# Altium project EFI_Main_Board-V1.00.PrjPcb (part 2 of 2)

## Sheet Peripheral_Sheet.SchDoc
size 420 x 297 mm; SheetNumber: 4; SheetTotal: 5
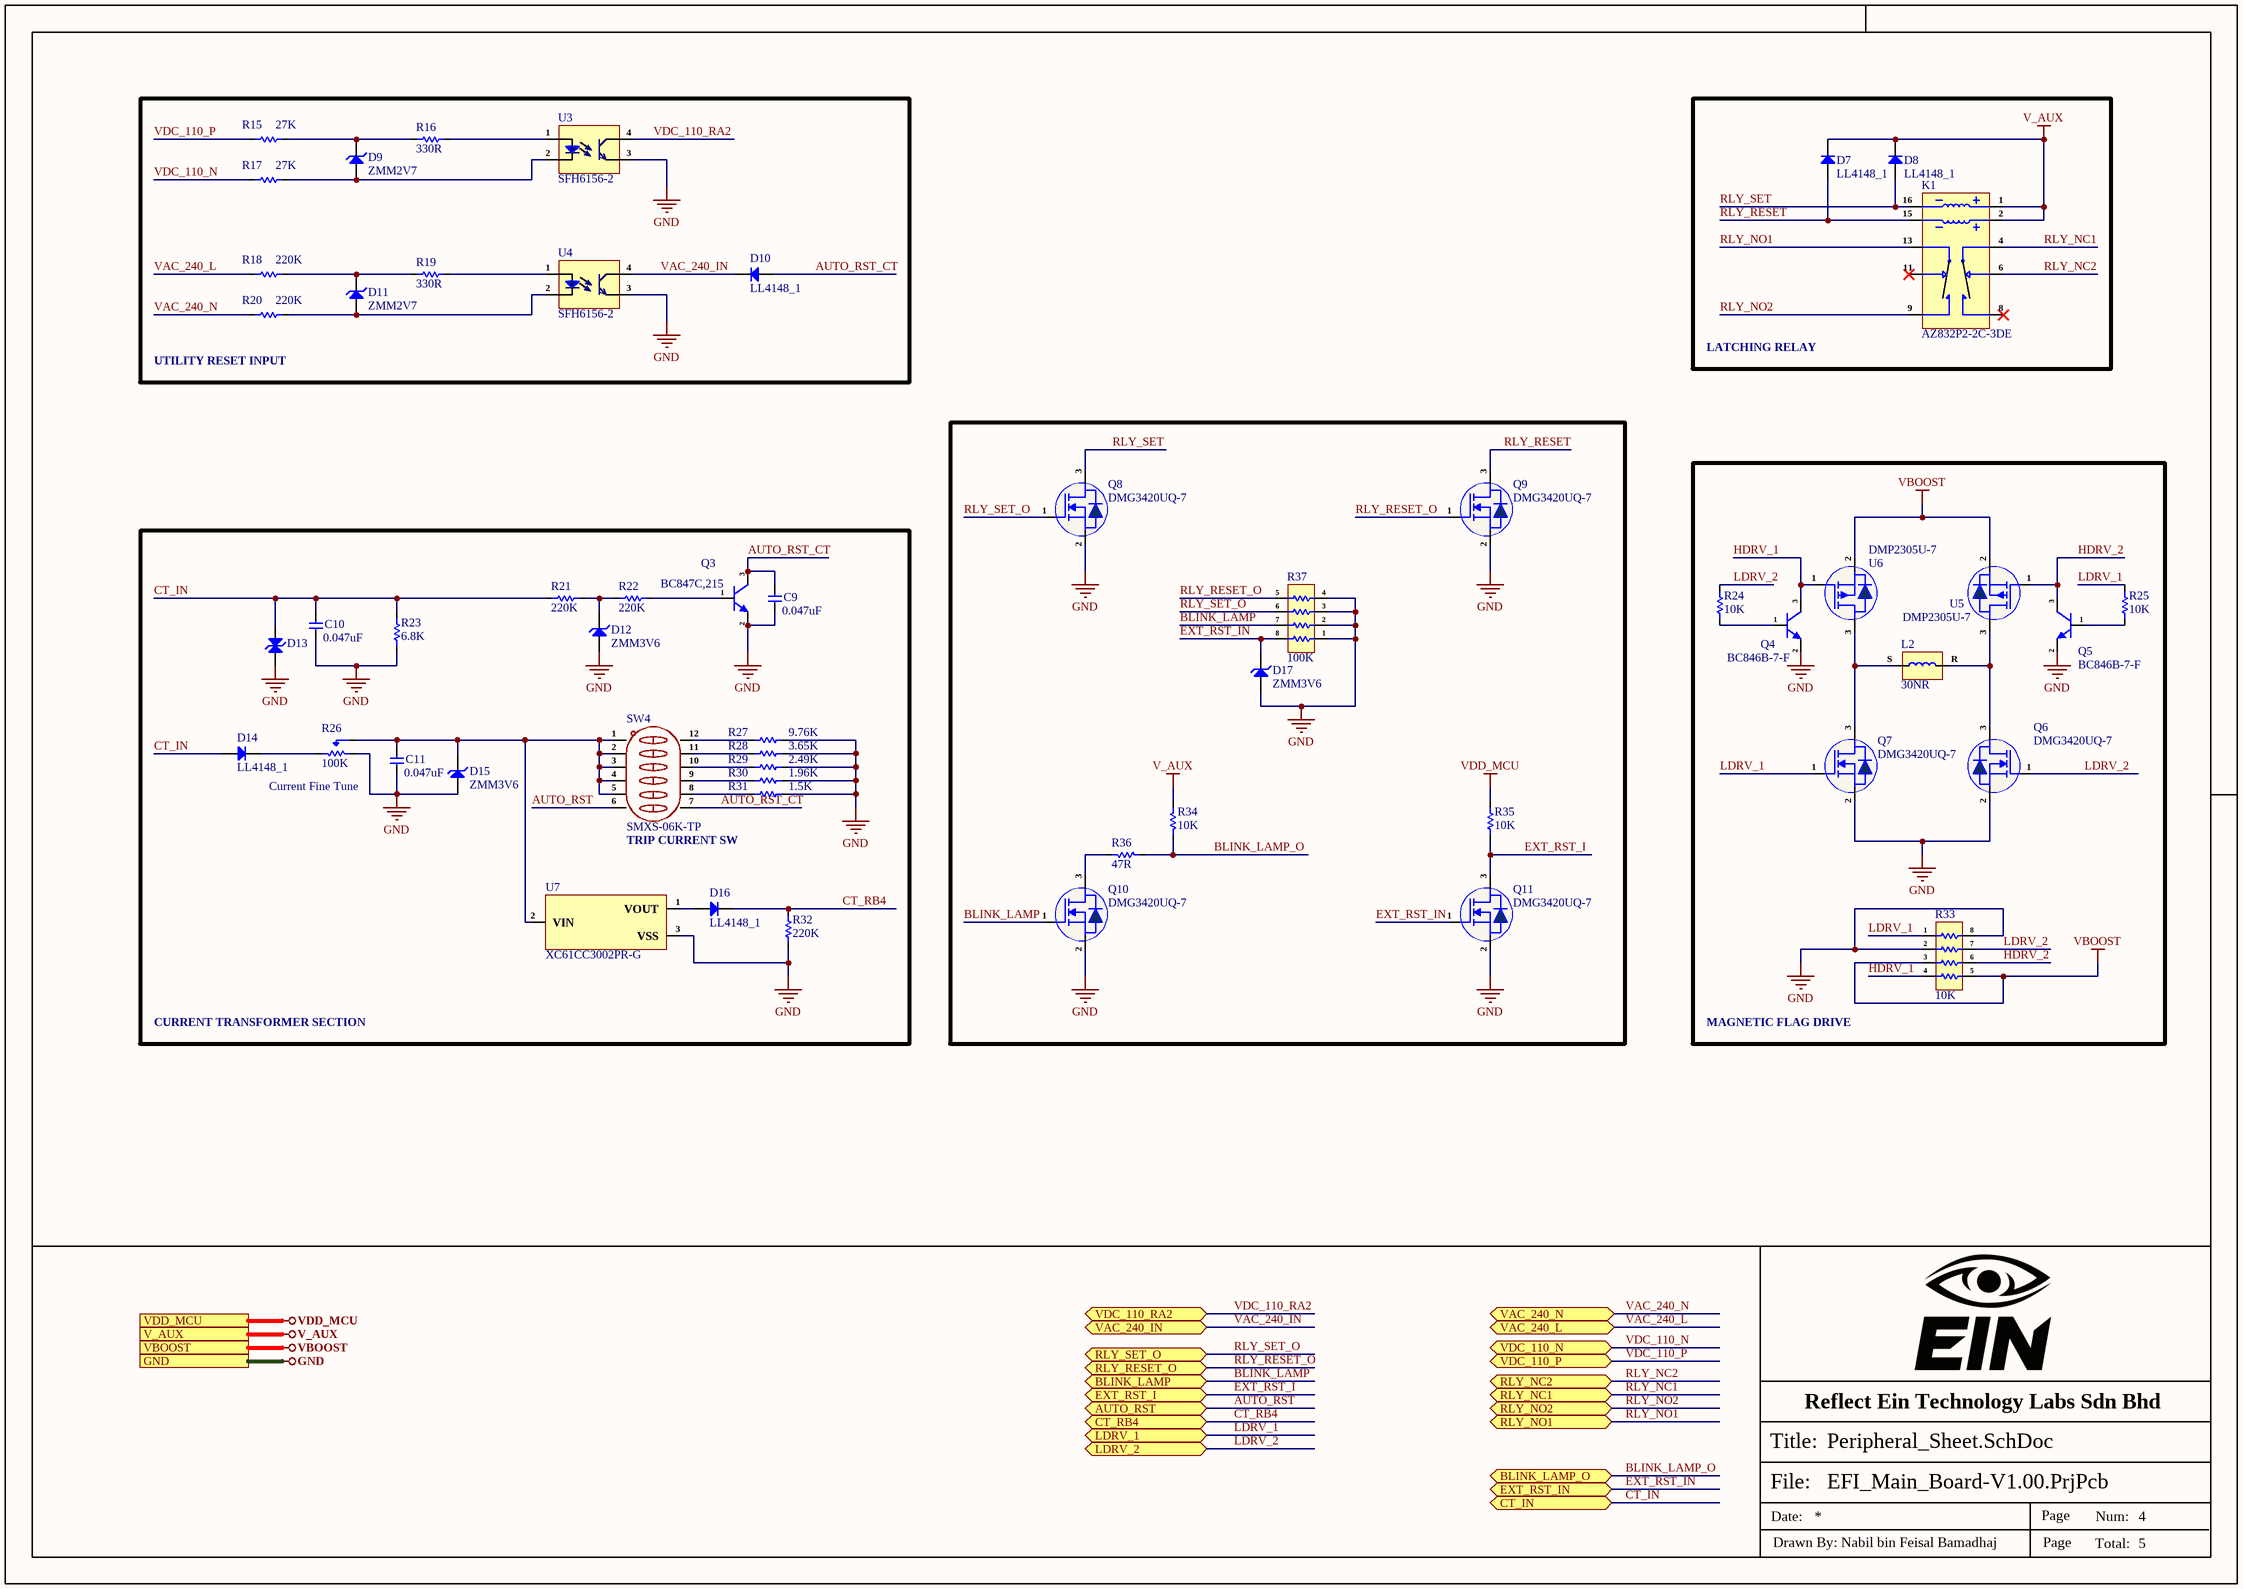
[diagram p4: Peripheral_Sheet.SchDoc]

### Parts
C9  0.047uF  [Cap-1206]
C10  0.047uF  [Cap-1206]
C11  0.047uF  [Cap-1206]
D7  LL4148_1  [LL-34]
D8  LL4148_1  [LL-34]
D9  ZMM2V7  [LL-34]
D10  LL4148_1  [LL-34]
D11  ZMM2V7  [LL-34]
D12  ZMM3V6  [LL-34]
D13  SMAJ48CA-E3/61  [SMA Bi Directional]  (value not drawn)
D14  LL4148_1  [LL-34]
D15  ZMM3V6  [LL-34]
D16  LL4148_1  [LL-34]
D17  ZMM3V6  [LL-34]
K1  AZ832P2-2C-3DE  [AZ832P2-2C-3DE]
L2  30NR  [30NR]
Q3  BC847C,215  [SOT-23]
Q4  BC846B-7-F  [SOT-23]
Q5  BC846B-7-F  [SOT-23]
Q6  DMG3420UQ-7  [SOT-23]
Q7  DMG3420UQ-7  [SOT-23]
Q8  DMG3420UQ-7  [SOT-23]
Q9  DMG3420UQ-7  [SOT-23]
Q10  DMG3420UQ-7  [SOT-23]
Q11  DMG3420UQ-7  [SOT-23]
R15  27K  [Res-1206]
R16  330R  [Res-1206]
R17  27K  [Res-1206]
R18  220K  [Res-1206]
R19  330R  [Res-1206]
R20  220K  [Res-1206]
R21  220K  [Res-1206]
R22  220K  [Res-1206]
R23  6.8K  [Res-1206]
R24  10K  [Res-1206]
R25  10K  [Res-1206]
R26  100K  [T93YA104KT20]
R27  9.76K  [Res-1206]
R28  3.65K  [Res-1206]
R29  2.49K  [Res-1206]
R30  1.96K  [Res-1206]
R31  1.5K  [Res-1206]
R32  220K  [Res-1206]
R33  10K  [0603x4]
R34  10K  [Res-1206]
R35  10K  [Res-1206]
R36  47R  [Res-1206]
R37  100K  [YC164-JR-070RL]
SW4  SMXS-06K-TP  [SMXS-06K-TP]
U3  SFH6156-2  [SFH6156-2]
U4  SFH6156-2  [SFH6156-2]
U5  DMP2305U-7  [SOT-23]
U6  DMP2305U-7  [SOT-23]
U7  XC61CC3002PR-G  [SOT-89-3]

### Blocks framed on the sheet
UTILITY RESET INPUT: D9-D11 R15-R20 U3 U4
LATCHING RELAY: D7 D8 K1
MAGNETIC FLAG DRIVE: L2 Q4-Q7 R24 R25 R33 U5 U6

### Ports
AUTO_RST (bidir, see Top-Sheet[4B], Controller_Sheet[4D]), BLINK_LAMP (bidir, see Top-Sheet[4B], Controller_Sheet[4D]), BLINK_LAMP_O (bidir, see Top-Sheet[4B], Connector_Sheet[4D]), CT_IN (bidir, see Top-Sheet[4B], Connector_Sheet[4D]), CT_RB4 (bidir, see Top-Sheet[4B], Controller_Sheet[4D]), EXT_RST_I (bidir, see Top-Sheet[4B], Controller_Sheet[4D]), EXT_RST_IN (bidir, see Top-Sheet[4B], Connector_Sheet[4D]), GND (see Top-Sheet[4B], Connector_Sheet[1D], Controller_Sheet[1D], Power_Sheet[1D]), LDRV_1 (bidir, see Top-Sheet[4B], Controller_Sheet[4D]), LDRV_2 (bidir, see Top-Sheet[4B], Controller_Sheet[4D]), RLY_NC1 (bidir, see Top-Sheet[4B], Connector_Sheet[4D]), RLY_NC2 (bidir, see Top-Sheet[4B], Connector_Sheet[4D]), RLY_NO1 (bidir, see Top-Sheet[4B], Connector_Sheet[4D]), RLY_NO2 (bidir, see Top-Sheet[4B], Connector_Sheet[4D]), RLY_RESET_O (bidir, see Top-Sheet[4B], Controller_Sheet[4D]), RLY_SET_O (bidir, see Top-Sheet[4B], Controller_Sheet[4D]), V_AUX (see Top-Sheet[4A], Connector_Sheet[1D], Power_Sheet[1D]), VAC_240_IN (bidir, see Top-Sheet[4B], Controller_Sheet[4D]), VAC_240_L (bidir, see Top-Sheet[4B], Connector_Sheet[4D]), VAC_240_N (bidir, see Top-Sheet[4B], Connector_Sheet[4D]), VBOOST (see Top-Sheet[4B], Power_Sheet[1D]), VDC_110_N (bidir, see Top-Sheet[4B], Connector_Sheet[4D]), VDC_110_P (bidir, see Top-Sheet[4B], Connector_Sheet[4D]), VDC_110_RA2 (bidir, see Top-Sheet[4B], Controller_Sheet[4D]), VDD_MCU (see Top-Sheet[4A], Controller_Sheet[1D], Power_Sheet[1D])

### Nets
GND: C9.1 C10.1 C11.1 D12.2(A) D13.1(A) D15.2(A) D17.2(A) Q3.2(E) Q4.2(E) Q5.2(E) Q6.2(S) Q7.2(S) Q8.2(S) Q9.2(S) Q10.2(S) Q11.2(S) R23.1 R26.1(CCW) R27.2 R28.2 R29.2 R30.2 R31.2 R32.2 R33.2 R33.8 R37.1 R37.2 R37.3 R37.4 U3.3(E) U4.3(E) U7.3(VSS) ; port GND
V_AUX: D7.1(K) D8.1(K) K1.1 K1.2 R34.2 ; port V_AUX
VBOOST: R33.3 R33.5 U5.2(S) U6.2(S) ; port VBOOST
VDD_MCU: R35.2 ; port VDD_MCU
AUTO_RST: SW4.6 ; port AUTO_RST
AUTO_RST_CT: C9.2 D10.2(A) Q3.3(C) SW4.7
BLINK_LAMP: Q10.1(G) R37.7 ; port BLINK_LAMP
BLINK_LAMP_O: R34.1 R36.1 ; port BLINK_LAMP_O
CT_IN: C10.2 D13.2(A) D14.2(A) R21.2 R23.2 ; port CT_IN
CT_RB4: D16.1(K) R32.1 ; port CT_RB4
EXT_RST_I: Q11.3(D) R35.1 ; port EXT_RST_I
EXT_RST_IN: D17.1(K) Q11.1(G) R37.8 ; port EXT_RST_IN
HDRV_1: Q4.3(C) R33.4 U6.1(G)
HDRV_2: Q5.3(C) R33.6 U5.1(G)
LDRV_1: Q7.1(G) R25.2 R33.1 ; port LDRV_1
LDRV_2: Q6.1(G) R24.2 R33.7 ; port LDRV_2
RLY_NC1: K1.4 ; port RLY_NC1
RLY_NC2: K1.6 ; port RLY_NC2
RLY_NO1: K1.13 ; port RLY_NO1
RLY_NO2: K1.9 ; port RLY_NO2
RLY_RESET: D7.2(A) K1.15 Q9.3(D)
RLY_RESET_O: Q9.1(G) R37.5 ; port RLY_RESET_O
RLY_SET: D8.2(A) K1.16 Q8.3(D)
RLY_SET_O: Q8.1(G) R37.6 ; port RLY_SET_O
VAC_240_IN: D10.1(K) U4.4(C) ; port VAC_240_IN
VAC_240_L: R18.2 ; port VAC_240_L
VAC_240_N: R20.2 ; port VAC_240_N
VDC_110_N: R17.1 ; port VDC_110_N
VDC_110_P: R15.1 ; port VDC_110_P
VDC_110_RA2: U3.4(C) ; port VDC_110_RA2
NetC11_2: C11.2 D15.1(K) R26.2(Wiper) SW4.1 SW4.2 SW4.3 SW4.4 SW4.5 U7.2(VIN)
NetD9_1: D9.1(K) R15.2 R16.1
NetD9_2: D9.2(A) R17.2 U3.2(Ca)
NetD11_1: D11.1(K) R18.1 R19.1
NetD11_2: D11.2(A) R20.1 U4.2(Ca)
NetD12_1: D12.1(K) R21.1 R22.2
NetD14_1: D14.1(K) R26.3(CW)
NetD16_2: D16.2(A) U7.1(VOUT)
NetL2_R: L2.R Q6.3(D) U5.3(D)
NetL2_S: L2.S Q7.3(D) U6.3(D)
NetQ3_1: Q3.1(B) R22.1
NetQ4_1: Q4.1(B) R24.1
NetQ5_1: Q5.1(B) R25.1
NetQ10_3: Q10.3(D) R36.2
NetR16_2: R16.2 U3.1(An)
NetR19_2: R19.2 U4.1(An)
NetR27_1: R27.1 SW4.12
NetR28_1: R28.1 SW4.11
NetR29_1: R29.1 SW4.10
NetR30_1: R30.1 SW4.9
NetR31_1: R31.1 SW4.8

Not connected (* = marked no-connect by the designer): K1 8* 11*

### Notes on the sheet
- Current Fine Tune
- (near SW4) TRIP CURRENT SW
- CURRENT TRANSFORMER SECTION
- Reflect Ein Technology Labs Sdn Bhd
- File:
- Title:
- Date:
- Page
- Num:
- Total:
- Drawn By: Nabil bin Feisal Bamadhaj

### Library data of the parts
C9-C11 = CC1206JRX7R0BB473: CAP CER 0.047UF 100V X7R 1206; Manufacturer: Yageo; Tolerance: 5%; Capacitance: 47nF; Item Type: Capacitor; Supplier 1: Arrow Electronics; Manufacturer Part Number: CC1206JRX7R0BB473; RoHS: Yes; Category: Ceramic Capacitors; Stock 1: 6600; Pricing 1: 1=0.21620, 10=0.10530, 25=0.10420, 100=0.08480, 250=0.08390, 500=0.05860, 1000=0.05090, 3000=0.04900, 6000=0.02930 (USD); Mount: Surface Mount; Case/Package: 1206; Case Code (Imperial): 1206; Case Code (Metric): 3216; Min Operating Temperature: -55°C; Max Operating Temperature: 125°C; Packaging: Tape and Reel; Voltage Rating (DC): 100V; Dielectric: X7R; Termination: SMD/SMT; Resistor Type: Ceramic; Voltage Rating: 100V; Series: CC; Construction: Flat; Length: 3.2mm; Width: 1.6mm; Height: 0.85mm; Thickness: 0.037inch; Depth: 1.6mm; Radiation Hardening: No; RoHS Compliant: Yes; ComponentLink1URL: https://datasheet.ciiva.com/11465/upy-np0x7r-mv-100-to-630v-9-11465413.pdf?src-supplier=Avnet; ComponentLink1Description: https://datasheet.ciiva.com/11465/upy-np0x7r-mv-100-to-630v-9-11465413.pdf?src-supplier=Avnet; ComponentLink2URL: https://datasheet.ciiva.com/13210/upy-gp-np0-16v-to-50v-8-13210277.pdf?src-supplier=Mouser; ComponentLink2Description: https://datasheet.ciiva.com/13210/upy-gp-np0-16v-to-50v-8-13210277.pdf?src-supplier=Mouser; Supplier Part Number 1: CC1206JRX7R0BB473; LCSC Part Number: C577197
D7 D8 D10 D14 D16 = LL4148_1: 100V 1V@50mA 4ns 300mA LL-34 Switching Diodes ROHS; Manufacturer: Yangzhou Yangjie Elec Tech; Manufacturer Part Number: LL4148; Item Type: Diode; Package: LL-34; LCSC Part Number: C211750; ComponentLink1Description: LCSC; ComponentLink1URL: https://www.lcsc.com/product-detail/Switching-Diodes_Yangzhou-Yangjie-Elec-Tech-LL4148_C211750.html
D9 D11 = ZMM2V7: Independent Type 2.5V~2.9V 500mW 2.7V LL-34 Zener Diodes ROHS; Manufacturer: HXY MOSFET; Item Type: Diode; Manufacturer Part Number: ZMM2V7; Package: LL-34; LCSC Part Number: C2891738; ComponentLink1Description: LCSC; ComponentLink1URL: https://www.lcsc.com/product-detail/Zener-Diodes_YONGYUTAI-ZMM2V7_C2891738.html
D12 D15 D17 = ZMM3V6: Independent Type 500mW 3.4V~3.8V 3.6V LL-34 Zener Diodes ROHS; Manufacturer: HXY MOSFET; Item Type: Diode; Manufacturer Part Number: ZMM3V6; Package: LL-34; LCSC Part Number: C5345988; ComponentLink1Description: LCSC; ComponentLink1URL: https://www.lcsc.com/product-detail/Zener-Diodes_HXY-MOSFET-ZMM3V6_C5345988.html
D13 = SMAJ48CA-E3/61: TVS DIODE 48VWM 77.4VC DO214AC; Manufacturer: Vishay Semiconductors; Item Type: TVS Diodes; Supplier: Mouser; LCSC Part Number: C1973118; Manufacturer Part Number: SMAJ48CA-E3/61; RoHS: Yes; Stock: 8896; Pricing: 1=0.35, 10=0.202, 50=0.202, 100=0.099, 1000=0.099, 10000=0.072 (USD); ComponentLink1URL: https://datasheet.ciiva.com/23942/1761247-23942001.pdf?src-supplier=Newark; ComponentLink1Description: https://datasheet.ciiva.com/23942/1761247-23942001.pdf?src-supplier=Newark; ComponentLink2URL: https://datasheet.ciiva.com/22636/548547-22636982.pdf?src-supplier=Element14; ComponentLink2Description: https://datasheet.ciiva.com/22636/548547-22636982.pdf?src-supplier=Element14
K1 = AZ832P2-2C-3DE: Magnetic Latching Relays ROHS; Manufacturer: ZETTLER; Item Type: Relay; Manufacturer Part Number: AZ832P2-2C-3DE; Package: Custom; LCSC Part Number: C20262850; ComponentLink1Description: LCSC; ComponentLink1URL: https://www.lcsc.com/product-detail/Magnetic-Latching-Relays_ZETTLER-AZ832P2-2C-3DE_C20262850.html?s_z=n_AZ832P2-2C-3DE
L2 = 30NR: Magnetic Status Indicator
Q3 = BC847C,215: TRANS NPN 45V 0.1A TO-236AB; Manufacturer: Nexperia; Item Type: BJTs; Polarity: 5054Direction; Supplier: Future Electronics; LCSC Part Number: C8664; Manufacturer Part Number: BC847C,215; RoHS: Yes; Stock: 18000; Pricing: 3000=0.0084, 12000=0.0081, 30000=0.0079, 75000=0.0077, 120000=0.0074 (USD); Pins: 3NUMBER; Packaging: 13Packaging; RoHS Compliant: Yes; ComponentLink1URL: http://www.farnell.com/datasheets/1856333.pdf?src-supplier=Farnell; ComponentLink1Description: http://www.farnell.com/datasheets/1856333.pdf?src-supplier=Farnell; ComponentLink2URL: https://assets.nexperia.com/documents/data-sheet/BC847_SER.pdf?src-supplier=Digikey; ComponentLink2Description: https://assets.nexperia.com/documents/data-sheet/BC847_SER.pdf?src-supplier=Digikey; ComponentLink3URL: https://datasheet.octopart.com/BC847C%2C215-NXP-Semiconductors-datasheet-20734447.pdf?src-supplier=Farnell; ComponentLink3Description: https://datasheet.octopart.com/BC847C%2C215-NXP-Semiconductors-datasheet-20734447.pdf?src-supplier=Farnell; ComponentLink4URL: https://datasheet.octopart.com/BC847C%2C215-Nexperia-datasheet-164345412.pdf?src-supplier=Future+Electronics; ComponentLink4Description: https://datasheet.octopart.com/BC847C%2C215-Nexperia-datasheet-164345412.pdf?src-supplier=Future+Electronics; ComponentLink5URL: https://datasheet.octopart.com/BC847C%2C215-Nexperia-datasheet-11982477.pdf?src-supplier=Newark; ComponentLink5Description: https://datasheet.octopart.com/BC847C%2C215-Nexperia-datasheet-11982477.pdf?src-supplier=Newark; ComponentLink6URL: https://datasheet.octopart.com/BC847C%2C215-Nexperia-datasheet-5341283.pdf?src-supplier=TME; ComponentLink6Description: https://datasheet.octopart.com/BC847C%2C215-Nexperia-datasheet-5341283.pdf?src-supplier=TME
Q4 Q5 = BC846B-7-F: TRANS NPN 65V 0.1A SOT23-3; Manufacturer: Diodes; Item Type: Transistors; Supplier: Future Electronics; Supplier Part Number: 3888237; Manufacturer Part Number: BC846B-7-F; RoHS: Yes; Category: BJTs; Stock: 4416000; Pricing: 3000=0.0363, 12000=0.0348, 45000=0.0335, 120000=0.0325, 300000=0.0309 (USD); ComponentLink1URL: https://datasheet.ciiva.com/15139/getdatasheetpartid-139519-15139459.pdf?src-supplier=Verical; ComponentLink1Description: https://datasheet.ciiva.com/15139/getdatasheetpartid-139519-15139459.pdf?src-supplier=Verical; ComponentLink2URL: https://datasheet.ciiva.com/22711/1911717-22711685.pdf?src-supplier=Element14; ComponentLink2Description: https://datasheet.ciiva.com/22711/1911717-22711685.pdf?src-supplier=Element14; LCSC Part Number: C183643
Q6-Q11 = DMG3420UQ-7: MOSFET BVDSS: 8V~24V SOT23 T&R 3; Manufacturer: Diodes; Item Type: MOSFETs; Supplier: Digikey; LCSC Part Number: C5157847; Manufacturer Part Number: DMG3420UQ-7; RoHS: Yes; Stock: 5879; Pricing: 1=0.45, 10=0.276, 100=0.1748, 500=0.1308, 1000=0.11658 (USD); RoHS Compliant: Yes
R15 R17 = FRC1206F2702TS: 250mW Thick Film Resistors 200V ±100ppm/℃ ±1% 27kΩ 1206 Chip Resistor - Surface Mount ROHS; Manufacturer: FOJAN; Manufacturer Part Number: FRC1206F2702TS; Package: 1206; LCSC Part Number: C2960927; Item Type: Resistor; ComponentLink1Description: LCSC; ComponentLink1URL: https://www.lcsc.com/product-detail/Chip-Resistor-Surface-Mount_FOJAN-FRC1206F2702TS_C2960927.html
R16 R19 = FRC1206F3300TS: 250mW Thick Film Resistors 200V ±100ppm/℃ ±1% 330Ω 1206 Chip Resistor - Surface Mount ROHS; Manufacturer: FOJAN; Manufacturer Part Number: FRC1206F3300TS; Package: 1206; LCSC Part Number: C2933675; Item Type: Resistor; ComponentLink1Description: LCSC; ComponentLink1URL: https://www.lcsc.com/product-detail/Chip-Resistor-Surface-Mount_FOJAN-FRC1206F3300TS_C2933675.html
R18 R20-R22 R32 = RT1206BRD07220KL: RES SMD 220K OHM 0.1% 1/4W 1206; Manufacturer: Yageo; Item Type: Resistors; Voltage Rating (DC): 200V; Supplier: Digikey; LCSC Part Number: C309663; Manufacturer Part Number: RT1206BRD07220KL; RoHS: Yes; Stock: 10004; Pricing: 1=0.34, 10=0.225, 50=0.1816, 100=0.1663, 500=0.1326, 1000=0.11628 (USD); Lead Free: 5697LeadFree; ComponentLink1URL: https://datasheet.ciiva.com/2587/pyu-rt-1-to-0-05-rohs-l-5-2587527.pdf?src-supplier=Digikey; ComponentLink1Description: https://datasheet.ciiva.com/2587/pyu-rt-1-to-0-05-rohs-l-5-2587527.pdf?src-supplier=Digikey
R23 = AR06BTCV6801A010: 250mW Thin Film Resistor 150V ±25ppm/℃ ±0.1% 6.8kΩ 1206 Chip Resistor - Surface Mount ROHS; Manufacturer: Viking Tech; Manufacturer Part Number: AR06BTCV6801A010; Package: 1206; LCSC Part Number: C374801; Item Type: Resistor; ComponentLink1Description: LCSC; ComponentLink1URL: https://www.lcsc.com/product-detail/Chip-Resistor-Surface-Mount_Viking-Tech-AR06BTCV6801A010_C374801.html
R24 R25 R34 R35 = AC1206FR-7W10KL: RES 10K OHM 1% 1/2W 1206; Manufacturer: Yageo; Item Type: Resistors; Value: 10kR; Supplier: Mouser; LCSC Part Number: C326700; Manufacturer Part Number: AC1206FR-7W10KL; RoHS: No; Stock: 10222; Pricing: 1=0.14, 10=0.052, 50=0.052, 100=0.029, 1000=0.018, 10000=0.011 (USD); Case/Package: 340Case; Packaging: 10Packaging
R26 = T93YA104KT20: TRIMMER 100K OHM 0.5W PC PIN TOP; Manufacturer: Vishay Sfernice; Item Type: Potensiometer; Value: 100kR; Tolerance: 10%; Power Rating: 500mW; Voltage Rating: 250V; Number of Turns: 21; Temperature Coefficient: 100ppm/°C; Supplier: Future Electronics; LCSC Part Number: C7061693; Manufacturer Part Number: T93YA104KT20; RoHS: Yes; Stock: 500; Pricing: 500=0.835, 1000=0.82, 1500=0.815, 2000=0.81, 2500=0.795 (USD); Mounting Technology: PCB,Through Hole; Min Operating Temperature: -55°C; Max Operating Temperature: 155°C; Packaging: Rail/Tube; Series: T93; Technology: CERMET; Package Quantity: 50; Resistor Type: Cermet; Taper: Linear; Termination: Pin; Max Power Dissipation: 500mW; Resistance Tolerance: 10%; Voltage Rating (AC): 250V; Length: 0.382inch; Width: 0.197inch; Height: 0.386inch; Depth: 5mm; Radiation Hardening: No; Lead Free: Lead Free; RoHS Compliant: Yes; Reach SVHC Compliant: Unknown; ComponentLink1URL: https://datasheet.ciiva.com/11831/0900766b80ed9ad6-11831453.pdf?src-supplier=Rs; ComponentLink1Description: https://datasheet.ciiva.com/11831/0900766b80ed9ad6-11831453.pdf?src-supplier=Rs; ComponentLink2URL: https://datasheet.ciiva.com/2156/t93-2156473.pdf?src-supplier=Digikey; ComponentLink2Description: https://datasheet.ciiva.com/2156/t93-2156473.pdf?src-supplier=Digikey; ComponentLink3URL: https://datasheet.ciiva.com/16367/t93-16367128.pdf?src-supplier=Future+Electronics; ComponentLink3Description: https://datasheet.ciiva.com/16367/t93-16367128.pdf?src-supplier=Future+Electronics
R27 = RT1206BRD079K76L: RES SMD 9.76K OHM 0.1% 1/4W 1206; Manufacturer: Yageo; Item Type: Resistors; Supplier: Digikey; LCSC Part Number: C870957; Manufacturer Part Number: RT1206BRD079K76L; RoHS: Yes; Pricing: 5000=0.0862 (USD); ComponentLink1URL: https://datasheet.ciiva.com/2587/pyu-rt-1-to-0-05-rohs-l-5-2587915.pdf?src-supplier=Digikey; ComponentLink1Description: https://datasheet.ciiva.com/2587/pyu-rt-1-to-0-05-rohs-l-5-2587915.pdf?src-supplier=Digikey
R28 = RT1206BRD073K65L: RES SMD 3.65K OHM 0.1% 1/4W 1206; Manufacturer: Yageo; Item Type: Resistors; Value: 3.65kR; Power Rating: 250mW; Voltage Rating: 200V; Temperature Coefficient: 25ppm/°C; Supplier: Digikey; LCSC Part Number: C870714; Manufacturer Part Number: RT1206BRD073K65L; RoHS: Yes; Stock: 4762; Pricing: 1=0.35, 10=0.246, 50=0.1938, 100=0.1693, 500=0.12954, 1000=0.11424 (USD); Case/Package: 1206; Case Code (Metric): 3216; Case Code (Imperial): 1206; Weight: 0.000571oz; Min Operating Temperature: -55°C; Max Operating Temperature: 155°C; Tolerance: 0.1%; Package Quantity: 5000; Packaging: Tape and Reel; Number of Terminations: 2; Termination: SMD/SMT; Max Power Dissipation: 250mW; Voltage Rating (DC): 200V; Series: RT; Length: 0.122inch; Width: 1.6mm; Height: 0.026inch; Lead Free: Lead Free; RoHS Compliant: Yes; ComponentLink1URL: https://datasheet.ciiva.com/2587/pyu-rt-1-to-0-05-rohs-l-5-2587684.pdf?src-supplier=Digikey; ComponentLink1Description: https://datasheet.ciiva.com/2587/pyu-rt-1-to-0-05-rohs-l-5-2587684.pdf?src-supplier=Digikey; ComponentLink2URL: https://datasheet.ciiva.com/12812/pyu-rt-1-to-0-05-rohs-l-4-12812222.pdf?src-supplier=Mouser; ComponentLink2Description: https://datasheet.ciiva.com/12812/pyu-rt-1-to-0-05-rohs-l-4-12812222.pdf?src-supplier=Mouser
R29 = ARG06BTC2491: 250mW 200V ±25ppm/℃ ±0.1% 2.49kΩ 1206 Chip Resistor - Surface Mount ROHS; Manufacturer: Viking Tech; Manufacturer Part Number: ARG06BTC2491; Package: 1206; LCSC Part Number: C5122072; Item Type: Resistor; ComponentLink1Description: LCSC; ComponentLink1URL: https://www.lcsc.com/product-detail/Chip-Resistor-Surface-Mount_Viking-Tech-ARG06BTC2491_C5122072.html
R30 = RT1206BRD071K96L: RES SMD 1.96K OHM 0.1% 1/4W 1206; Manufacturer: Yageo; Item Type: Resistors; Value: 1.96kR; Temperature Coefficient: 25ppm/°C; Power Rating: 250mW; Voltage Rating: 200V; Supplier: Digikey; LCSC Part Number: C870518; Manufacturer Part Number: RT1206BRD071K96L; RoHS: Yes; Stock: 1289; Pricing: 1=0.34, 10=0.246, 50=0.1908, 100=0.1693, 500=0.1275, 1000=0.1122 (USD); Case/Package: 1206; Contact Plating: Tin,Matte; Case Code (Metric): 3216; Case Code (Imperial): 1206; Min Operating Temperature: -55°C; Max Operating Temperature: 125°C; Tolerance: 0.1%; Package Quantity: 5000; Packaging: Tape and Reel; Number of Terminations: 2; Termination: SMD/SMT; Max Power Dissipation: 250mW; Voltage Rating (DC): 200V; Series: RT; Length: 0.122inch; Width: 0.063inch; Height: 0.026inch; Lead Free: Lead Free; RoHS Compliant: Yes; ComponentLink1URL: https://datasheet.ciiva.com/2587/pyu-rt-1-to-0-05-rohs-l-5-2587508.pdf?src-supplier=Digikey; ComponentLink1Description: https://datasheet.ciiva.com/2587/pyu-rt-1-to-0-05-rohs-l-5-2587508.pdf?src-supplier=Digikey; ComponentLink2URL: https://datasheet.ciiva.com/8894/pyu-rt-1-to-0-05-rohs-l-4-8894855.pdf?src-supplier=Avnet; ComponentLink2Description: https://datasheet.ciiva.com/8894/pyu-rt-1-to-0-05-rohs-l-4-8894855.pdf?src-supplier=Avnet; ComponentLink3URL: https://datasheet.ciiva.com/12706/pyu-rt-1-to-0-05-rohs-l-4-12706684.pdf?src-supplier=Mouser; ComponentLink3Description: https://datasheet.ciiva.com/12706/pyu-rt-1-to-0-05-rohs-l-4-12706684.pdf?src-supplier=Mouser
R31 = RT1206BRD071K5L: RES SMD 1.5K OHM 0.1% 1/4W 1206; Manufacturer: Yageo; Item Type: Resistors; Value: 1.5kR; Power Rating: 250mW; Voltage Rating: 200V; Temperature Coefficient: 25ppm/°C; Supplier: Mouser; LCSC Part Number: C706403; Manufacturer Part Number: RT1206BRD071K5L; RoHS: Yes; Stock: 5782; Pricing: 1=0.36, 10=0.261, 50=0.202, 100=0.181, 1000=0.121, 10000=0.089 (USD); Case/Package: 1206; Case Code (Imperial): 1206; Case Code (Metric): 3216; Contact Plating: Tin,Matte; Min Operating Temperature: -55°C; Max Operating Temperature: 125°C; Tolerance: 0.1%; Packaging: Tape and Reel; Package Quantity: 5000; Number of Terminations: 2; Termination: SMD/SMT; Max Power Dissipation: 250mW; Voltage Rating (DC): 200V; Features: Moisture Resistant; Series: RT; Length: 0.122inch; Width: 0.063inch; Height: 0.026inch; Lead Free: Lead Free; RoHS Compliant: Yes; ComponentLink1URL: https://datasheet.ciiva.com/8895/pyu-rt-1-to-0-05-rohs-l-4-8895366.pdf?src-supplier=Avnet; ComponentLink1Description: https://datasheet.ciiva.com/8895/pyu-rt-1-to-0-05-rohs-l-4-8895366.pdf?src-supplier=Avnet; ComponentLink2URL: https://datasheet.ciiva.com/12703/pyu-rt-1-to-0-05-rohs-l-4-12703031.pdf?src-supplier=Mouser; ComponentLink2Description: https://datasheet.ciiva.com/12703/pyu-rt-1-to-0-05-rohs-l-4-12703031.pdf?src-supplier=Mouser; ComponentLink3URL: https://datasheet.ciiva.com/2587/pyu-rt-1-to-0-05-rohs-l-4-2587497.pdf?src-supplier=Digikey; ComponentLink3Description: https://datasheet.ciiva.com/2587/pyu-rt-1-to-0-05-rohs-l-4-2587497.pdf?src-supplier=Digikey; ComponentLink4URL: https://datasheet.ciiva.com/46635/pyu-rt-1-to-0-05-rohs-l-5-46635017.pdf?src-supplier=Digikey; ComponentLink4Description: https://datasheet.ciiva.com/46635/pyu-rt-1-to-0-05-rohs-l-5-46635017.pdf?src-supplier=Digikey
R33 = 4D03WGJ0103T5E: 4 ±5% 10kΩ 62.5mW ±200ppm/℃ 0603x4 Resistor Networks, Arrays ROHS; Manufacturer: Royal Electronic Factory; Value: 10kR; Temperature Coefficient: 400ppm/°C; Supplier: Mouser; LCSC Part Number: C29718; Manufacturer Part Number: 4D03WGJ0103T5E; RoHS: No; Item Type: Resistor; Pricing: 10000=0.005 (USD); ComponentLink1URL: https://datasheet.octopart.com/4D03WGJ0103T5E-Royal-Ohm-datasheet-158295248.pdf?src-supplier=TME; ComponentLink1Description: https://datasheet.octopart.com/4D03WGJ0103T5E-Royal-Ohm-datasheet-158295248.pdf?src-supplier=TME
R36 = FRC1206F47R0TS: 250mW Thick Film Resistors 200V ±100ppm/℃ ±1% 47Ω 1206 Chip Resistor - Surface Mount ROHS; Manufacturer: FOJAN; Manufacturer Part Number: FRC1206F47R0TS; Package: 1206; LCSC Part Number: C2933712; Item Type: Resistor; ComponentLink1Description: LCSC; ComponentLink1URL: https://www.lcsc.com/product-detail/Chip-Resistor-Surface-Mount_FOJAN-FRC1206F47R0TS_C2933712.html
R37 = YC164-JR-07100KL: RES ARRAY 4 RES 100K OHM 1206; Manufacturer: Yageo; Item Type: Resistor; Supplier: Future Electronics; Supplier Part Number: 4734737; Manufacturer Part Number: YC164-JR-07100KL; RoHS: Yes; Category: Resistor Arrays; Stock: 10000; Pricing: 5000=0.0086, 20000=0.0082, 50000=0.0078, 100000=0.0078, 125000=0.0075, 200000=0.0076, 625000=0.0071 (USD); ComponentLink1URL: https://datasheet.ciiva.com/11807/0900766b80c69e1d-11807026.pdf?src-supplier=Rs; ComponentLink1Description: https://datasheet.ciiva.com/11807/0900766b80c69e1d-11807026.pdf?src-supplier=Rs; ComponentLink2URL: https://datasheet.ciiva.com/8017/443424-8017993.pdf?src-supplier=Element14; ComponentLink2Description: https://datasheet.ciiva.com/8017/443424-8017993.pdf?src-supplier=Element14; ComponentLink3URL: https://datasheet.ciiva.com/8017/443424-8017994.pdf?src-supplier=Element14; ComponentLink3Description: https://datasheet.ciiva.com/8017/443424-8017994.pdf?src-supplier=Element14; ComponentLink4URL: https://datasheet.ciiva.com/17478/pyu-yc-tc164-51-rohs-l-3-17478885.pdf?src-supplier=Future+Electronics; ComponentLink4Description: https://datasheet.ciiva.com/17478/pyu-yc-tc164-51-rohs-l-3-17478885.pdf?src-supplier=Future+Electronics; ComponentLink5URL: https://datasheet.ciiva.com/2693/pyu-yc-tc164-51-rohs-l-3-2693249.pdf?src-supplier=Digi-Key; ComponentLink5Description: https://datasheet.ciiva.com/2693/pyu-yc-tc164-51-rohs-l-3-2693249.pdf?src-supplier=Digi-Key; ComponentLink6URL: https://datasheet.ciiva.com/2693/pyu-yc-tc164-51-rohs-l-3-2693250.pdf?src-supplier=Digi-Key; ComponentLink6Description: https://datasheet.ciiva.com/2693/pyu-yc-tc164-51-rohs-l-3-2693250.pdf?src-supplier=Digi-Key; ComponentLink7URL: https://datasheet.ciiva.com/2693/pyu-yc-tc164-51-rohs-l-3-2693251.pdf?src-supplier=Digi-Key; ComponentLink7Description: https://datasheet.ciiva.com/2693/pyu-yc-tc164-51-rohs-l-3-2693251.pdf?src-supplier=Digi-Key; LCSC Part Number: C192933
SW4 = SMXS-06K-TP: 6 digits 24V Black 25mA 3000 Times SMD DIP Switches ROHS; Manufacturer: SM Switch; Manufacturer Part Number: SMXS-06K-TP; Package: SMD; LCSC Part Number: C5439765; Item Type: DIP SWITCH; ComponentLink1Description: LCSC; ComponentLink1URL: https://www.lcsc.com/product-detail/DIP-Switches_SM-Switch-SMXS-06K-TP_C5439765.html
U3 U4 = SFH6156-2: OPTOISOLATOR 5.3KV TRANS 4SMD; Manufacturer: Vishay; Item Type: IC; Supplier: Mouser; LCSC Part Number: C5156027; Manufacturer Part Number: SFH6156-2; RoHS: No; Stock: 11480; Pricing: 1=0.56, 10=0.37, 50=0.37, 100=0.253, 1000=0.218, 10000=0.217 (USD)
U5 U6 = DMP2305U-7: MOSFET P-CH 20V 4.2A SOT23-3; Manufacturer: Diodes Zetex; Item Type: MOSFETs; Supplier: Future Electronics; LCSC Part Number: C85097; Manufacturer Part Number: DMP2305U-7; RoHS: Yes; Stock: 207000; Pricing: 3000=0.0412, 9000=0.0402, 15000=0.0398, 45000=0.0388, 75000=0.038 (USD); ComponentLink1URL: https://datasheet.ciiva.com/13059/ds31737-52560-13059868.pdf?src-supplier=Mouser; ComponentLink1Description: https://datasheet.ciiva.com/13059/ds31737-52560-13059868.pdf?src-supplier=Mouser; ComponentLink2URL: https://datasheet.ciiva.com/11176/ds31737-11176455.pdf?src-supplier=Avnet; ComponentLink2Description: https://datasheet.ciiva.com/11176/ds31737-11176455.pdf?src-supplier=Avnet
U7 = XC61CC3002PR-G: Supervisory Circuits; Manufacturer: Torex; Item Type: IC; Manufacturer Part Number: XC61CC3002PR-G; Package: SOT-89; LCSC Part Number: -; ComponentLink1Description: Torex; ComponentLink1URL: https://direct.torexsemi.com/en-us/product/xc61c/xc61cc3002pr-g

## Nets that join several sheets
GND: Controller_Sheet (15 pins), Power_Sheet (10 pins), Connector_Sheet (J5.7), Peripheral_Sheet (33 pins)
V_AUX: Power_Sheet (C2.1 D3.1 L1.1), Connector_Sheet (J5.3 J5.4), Peripheral_Sheet (5 pins)
VBOOST: Power_Sheet (C3.1 C4.1 D4.1 R2.2), Peripheral_Sheet (R33.3 R33.5 U5.2 U6.2)
VDD_MCU: Controller_Sheet (7 pins), Power_Sheet (C1.1 D2.1), Peripheral_Sheet (R35.2)
AUTO_RST: Controller_Sheet (R11.2 U2.1), Peripheral_Sheet (SW4.6)
BATT_LOAD: Controller_Sheet (U2.24), Power_Sheet (Q2.1 R5.2)
BATT_LOW_SNS: Controller_Sheet (U2.15), Power_Sheet (D1.1)
BLINK_LAMP: Controller_Sheet (U2.19), Peripheral_Sheet (Q10.1 R37.7)
BLINK_LAMP_O: Connector_Sheet (J5.2), Peripheral_Sheet (R34.1 R36.1)
BOOST_FB1: Controller_Sheet (U2.26), Power_Sheet (R2.1 R3.2)
BOOST_FB2: Controller_Sheet (U2.27), Power_Sheet (R3.1)
BOOST_PWR: Controller_Sheet (U2.25), Power_Sheet (Q1.1 R4.2)
CT_IN: Connector_Sheet (J5.6), Peripheral_Sheet (5 pins)
CT_RB4: Controller_Sheet (U2.14), Peripheral_Sheet (D16.1 R32.1)
EXT_RST_I: Controller_Sheet (U2.11), Peripheral_Sheet (Q11.3 R35.1)
EXT_RST_IN: Connector_Sheet (R38.1), Peripheral_Sheet (D17.1 Q11.1 R37.8)
LDRV_1: Controller_Sheet (U2.9), Peripheral_Sheet (Q7.1 R25.2 R33.1)
LDRV_2: Controller_Sheet (U2.10), Peripheral_Sheet (Q6.1 R24.2 R33.7)
RLY_NC1: Connector_Sheet (J4.6), Peripheral_Sheet (K1.4)
RLY_NC2: Connector_Sheet (J4.5), Peripheral_Sheet (K1.6)
RLY_NO1: Connector_Sheet (J5.1), Peripheral_Sheet (K1.13)
RLY_NO2: Connector_Sheet (J4.7), Peripheral_Sheet (K1.9)
RLY_RESET_O: Controller_Sheet (U2.2), Peripheral_Sheet (Q9.1 R37.5)
RLY_SET_O: Controller_Sheet (U2.3), Peripheral_Sheet (Q8.1 R37.6)
VAC_240_IN: Controller_Sheet (D5.1), Peripheral_Sheet (D10.1 U4.4)
VAC_240_L: Connector_Sheet (J4.2), Peripheral_Sheet (R18.2)
VAC_240_N: Connector_Sheet (J4.1), Peripheral_Sheet (R20.2)
VDC_110_N: Connector_Sheet (J4.3), Peripheral_Sheet (R17.1)
VDC_110_P: Connector_Sheet (J4.4), Peripheral_Sheet (R15.1)
VDC_110_RA2: Controller_Sheet (R6.2 U2.21), Peripheral_Sheet (U3.4)